# Altium schematic sheet Atrium_Power_Island.SchDoc
size 420 x 297 mm; Symbol: Drawing-Symbol_A3; @Project Name: Atrium; @Page Count: 1; @Update Date: 2026-11-08; @Create Date: 2026-11-08; @Schematic Name: Power_Schematic; @Page No: 1; @Page Name: P1; Company: EasyEDA.com; Version: V1.0; Page Size: A3; Device: Drawing-Symbol_A3; @Create Time: 01:36:29; @Update Time: 01:36:29; Border: 1; Width: 1655; Height: 1170; Region Start: 1; X Region Count: 6; Y Region Count: 4; Blade Width: 10; Title Block Position: 3; @Board Name: Power_Island
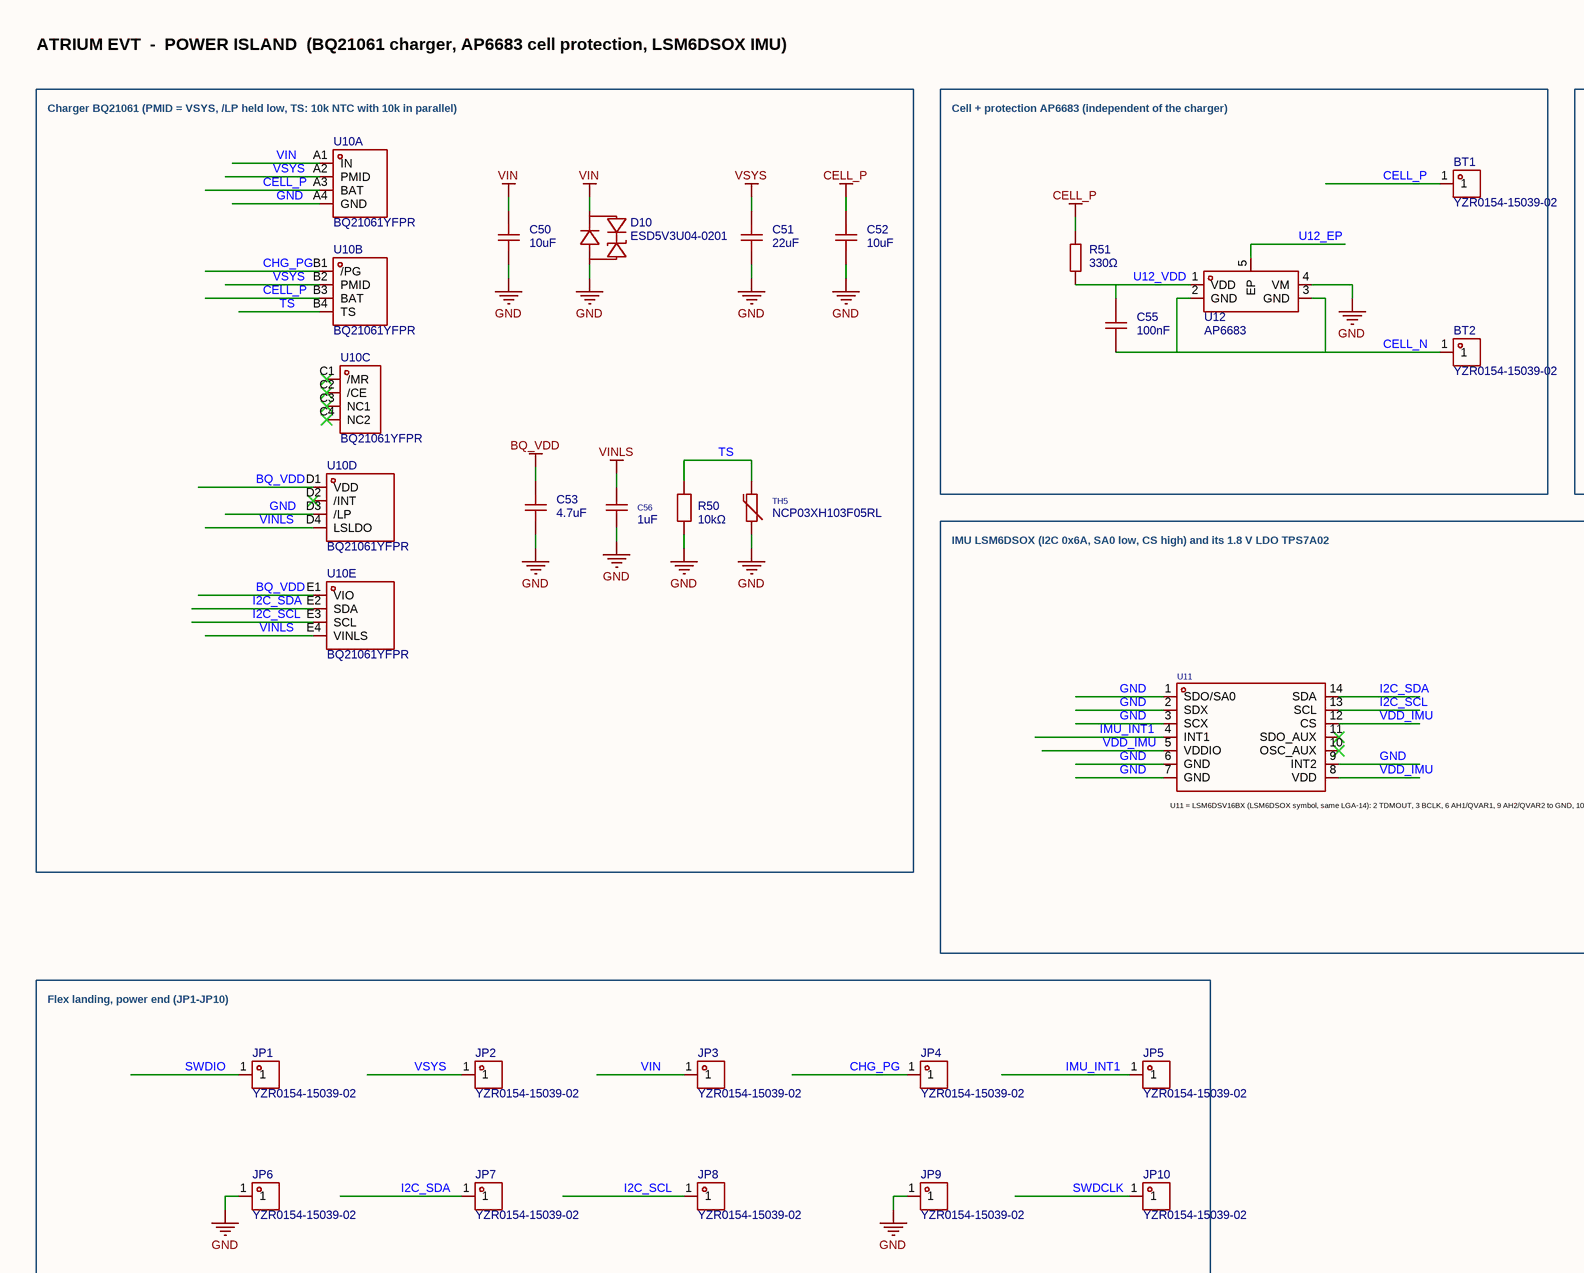
[diagram p0: Atrium_Power_Island.SchDoc, top left]
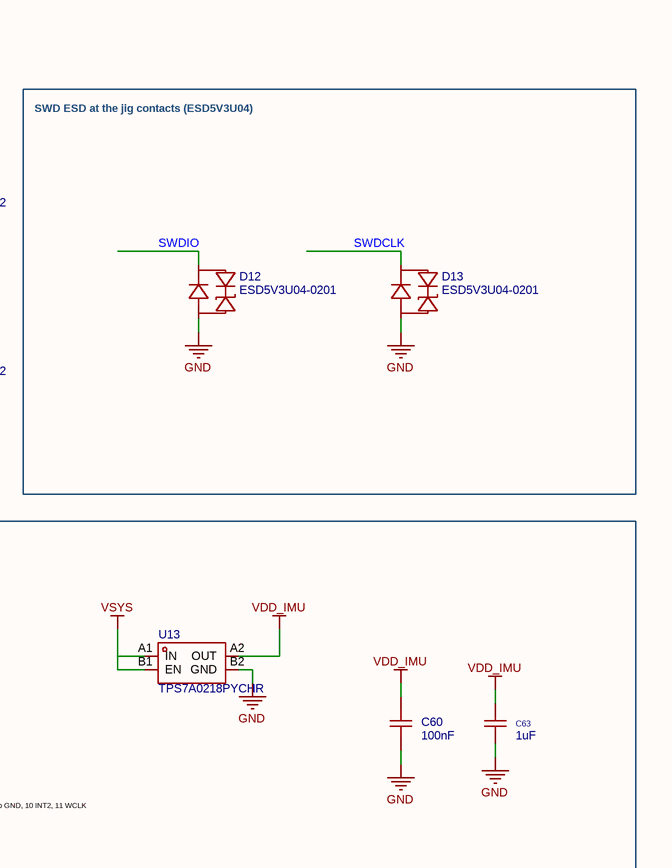
[diagram p1: Atrium_Power_Island.SchDoc, top right]
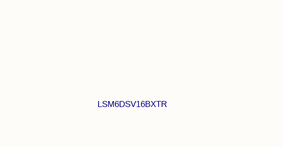
[diagram p2: Atrium_Power_Island.SchDoc, bottom left]

## Parts
BT1  YZR0154-15039-02  [TESTPOINT-SMD_BD1.5-H3.9]
BT2  YZR0154-15039-02  [TESTPOINT-SMD_BD1.5-H3.9]
C50  10uF  [C0402]
C51  22uF  [C0402]
C52  10uF  [C0402]
C53  4.7uF  [C0402]
C55  100nF  [C0201]
C56  1uF  [C0201]
C60  100nF  [C0201]
C63  1uF  [C0201]
D10  ESD5V3U04-0201  [X3-DFN0603-2_L0.6-W0.3-RD]
D12  ESD5V3U04-0201  [X3-DFN0603-2_L0.6-W0.3-RD]
D13  ESD5V3U04-0201  [X3-DFN0603-2_L0.6-W0.3-RD]
JP1  YZR0154-15039-02  [TESTPOINT-SMD_BD1.5-H3.9]
JP2  YZR0154-15039-02  [TESTPOINT-SMD_BD1.5-H3.9]
JP3  YZR0154-15039-02  [TESTPOINT-SMD_BD1.5-H3.9]
JP4  YZR0154-15039-02  [TESTPOINT-SMD_BD1.5-H3.9]
JP5  YZR0154-15039-02  [TESTPOINT-SMD_BD1.5-H3.9]
JP6  YZR0154-15039-02  [TESTPOINT-SMD_BD1.5-H3.9]
JP7  YZR0154-15039-02  [TESTPOINT-SMD_BD1.5-H3.9]
JP8  YZR0154-15039-02  [TESTPOINT-SMD_BD1.5-H3.9]
JP9  YZR0154-15039-02  [TESTPOINT-SMD_BD1.5-H3.9]
JP10  YZR0154-15039-02  [TESTPOINT-SMD_BD1.5-H3.9]
R50  10kΩ  [R0201]
R51  330Ω  [R0201]
TH5  NCP03XH103F05RL  [R0201]
U10  BQ21061YFPR  [DSBGA-20_L2.0-W1.6-R4-C5-P0.40-BL-1]  (parts A,B,C,D,E of 5)
U11  LSM6DSV16BXTR  [LGA-14L_L3.0-W2.5-P0.50-TL]
U12  AP6683  [DFN-4_L1.0-W1.0-P0.65-BL-EP]
U13  TPS7A0218PYCHR  [WLCSP-4_L0.6-W0.6-P0.35-R2-C2-TL]

## Blocks framed on the sheet
Cell + protection AP6683 (independent of the charger): BT1 BT2 C55 R51 U12
SWD ESD at the jig contacts (ESD5V3U04): D12 D13
Flex landing, power end (JP1-JP10): JP1-JP10

## Nets
BQ_VDD: C53.1 U10.D1(VDD) U10.E1(VIO)
CELL_P: BT1.1 C52.1 R51.1 U10.A3(BAT) U10.B3(BAT)
GND: C50.2 C51.2 C52.2 C53.2 C56.2 C60.2 C63.2 D10.2(A) D12.2(A) D13.2(A) JP6.1 JP9.1 R50.2 TH5.2 U10.A4(GND) U10.D3(/LP) U11.1(SDO/SA0) U11.2(SDX) U11.3(SCX) U11.6(GND) U11.7(GND) U11.9(INT2) U12.4(VM) U13.B2(GND)
VDD_IMU: C60.1 C63.1 U11.5(VDDIO) U11.8(VDD) U11.12(CS) U13.A2(OUT)
VIN: C50.1 D10.1(K) JP3.1 U10.A1(IN)
VINLS: C56.1 U10.D4(LSLDO) U10.E4(VINLS)
VSYS: C51.1 JP2.1 U10.A2(PMID) U10.B2(PMID) U13.A1(IN) U13.B1(EN)
CELL_N: BT2.1 C55.2 U12.2(GND) U12.3(GND)
CHG_PG: JP4.1 U10.B1(/PG)
I2C_SCL: JP8.1 U10.E3(SCL) U11.13(SCL)
I2C_SDA: JP7.1 U10.E2(SDA) U11.14(SDA)
IMU_INT1: JP5.1 U11.4(INT1)
SWDCLK: D13.1(K) JP10.1
SWDIO: D12.1(K) JP1.1
TS: R50.1 TH5.1 U10.B4(TS)
U12_EP: U12.5(EP)
U12_VDD: C55.1 R51.2 U12.1(VDD)

Not connected (* = marked no-connect by the designer): U10 C1(/MR)* C2(/CE)* C3(NC1)* C4(NC2)* D2(/INT)*; U11 10(OSC_AUX)* 11(SDO_AUX)*

## Notes on the sheet
- ATRIUM EVT  -  POWER ISLAND  (BQ21061 charger, AP6683 cell protection, LSM6DSOX IMU)
- (near U10) Charger BQ21061 (PMID = VSYS, /LP held low, TS: 10k NTC with 10k in parallel)
- IMU LSM6DSOX (I2C 0x6A, SA0 low, CS high) and its 1.8 V LDO TPS7A02
- (near U11) U11 = LSM6DSV16BX (LSM6DSOX symbol, same LGA-14): 2 TDMOUT, 3 BCLK, 6 AH1/QVAR1, 9 AH2/QVAR2 to GND, 10 INT2, 11 WCLK
- Create at
- 2026-11-08
- Schematic
- Board
- Power_Schematic
- Power_Island
- Update at
- Page
- P1
- Drawn
- Reviewed
- Atrium
- Version
- V1.0
- Size
- A3
- Page  1  Total  1
- EasyEDA.com

## Library data of the parts
BT1 BT2 JP1-JP10 = YZR0154-15039-02: Type:Pogo Pin Number of Pins:1P Overall Length/Height:3.9mm Operational Height:3.1mm Contact Resistance:50mΩ Elastic Life:10000 times Current Rating:1A Voltage Rating:12V Contact Material:Lead-Free Copper Contact Plating:Gold Operating Temperature:-20℃~+7; Manufacturer: Xinyangze(鑫扬泽); Add into BOM: no; Overall Length/Height: 3.9mm; Operational Height: 3.1mm; Contact Resistance: 50mΩ; Current Rating: 1A; Voltage Rating: 12V; Symbol: YZR0154-15039-02; Device: YZR0154-15039-02; Convert to PCB: no; LCSC Part Name: POGO PIN贴片型弹簧顶针; Supplier Part: C5157388; Manufacturer Part: YZR0154-15039-02; Supplier Footprint: -; JLCPCB Part Class: Extended Part; Datasheet: https://item.szlcsc.com/datasheet/YZR0154-15039-02/5795506.html; Supplier: LCSC; Type: Pogo Pin; Number of Pins: 1P; Elastic Life: 10000 times; Contact Material: Lead-Free Copper; Contact Plating: Gold; Operating Temperature: -20℃~+70℃; FootprintName: TESTPOINT-SMD_BD1.5-H3.9
C50 C52 = CL05A106MP5NUNC_C315248: Capacitance:10uF Tolerance:±20% Tolerance:±20% Voltage Rating:10V Temperature Coefficient:X5R; Manufacturer: SAMSUNG(三星); Add into BOM: yes; Tolerance: ±20%; Voltage Rating: 10V; Temperature Coefficient: X5R; ModelId: b7d13df3e9464d7a99d0651d1a5b4d570819f05c4eef4c71ace90d822a990e87; ModelName: C0402_L1.0-W0.5-H0.5; ModelTransform: 39.37,19.685,0,0,0,0,0,0,0; Symbol: CL05A106MP5NUNC_C315248; Device: CL05A106MP5NUNC_C315248; Convert to PCB: yes; Manufacturer Part: CL05A106MP5NUNC; Supplier: LCSC; Supplier Part: C315248; LCSC Part Name: 10uF ±20% 10V; Supplier Footprint: 0402; JLCPCB Part Class: Extended Part; Datasheet: https://item.szlcsc.com/datasheet/CL05A106MP5NUNC/297154.html; Value: 10uF; FootprintName: C0402
C51 = GRM155R60J226ME11D: Capacitance:22uF Tolerance:±20% Tolerance:±20% Voltage Rating:6.3V Temperature Coefficient:X5R; Manufacturer: muRata(村田); Add into BOM: yes; Tolerance: ±20%; Voltage Rating: 6.3V; Temperature Coefficient: X5R; ModelId: b7d13df3e9464d7a99d0651d1a5b4d570819f05c4eef4c71ace90d822a990e87; ModelName: C0402_L1.0-W0.5-H0.5; ModelTransform: 39.37,19.685,0,0,0,0,0,0,0; Symbol: GRM155R60J226ME11D; Device: GRM155R60J226ME11D; Convert to PCB: yes; Manufacturer Part: GRM155R60J226ME11D; Supplier: LCSC; Supplier Part: C415703; LCSC Part Name: 22uF ±20% 6.3V; Supplier Footprint: 0402; JLCPCB Part Class: Extended Part; Datasheet: https://item.szlcsc.com/datasheet/GRM155R60J226ME11D/408393.html; Value: 22uF; FootprintName: C0402
C53 = CL05A475MP5NRNC: Capacitance:4.7uF Tolerance:±20% Tolerance:±20% Voltage Rating:10V Temperature Coefficient:X5R; Manufacturer: SAMSUNG(三星); Add into BOM: yes; 3D Model: b7d13df3e9464d7a99d0651d1a5b4d570819f05c4eef4c71ace90d822a990e87; 3D Model Transform: 39.37,19.685,0,0,0,0,0,0,0; Tolerance: ±20%; Voltage Rating: 10V; Temperature Coefficient: X5R; ModelName: C0402_L1.0-W0.5-H0.5; Symbol: CL05A475MP5NRNC; Device: CL05A475MP5NRNC; Convert to PCB: yes; LCSC Part Name: 4.7uF ±20% 10V; Supplier Part: C23733; Manufacturer Part: CL05A475MP5NRNC; Supplier Footprint: 0402; JLCPCB Part Class: Basic Part; Datasheet: https://item.szlcsc.com/datasheet/CL05A475MP5NRNC/24469.html; Supplier: LCSC; Value: 4.7uF; FootprintName: C0402
C55 C60 = GRM033R60J104KE19D: Capacitance:100nF Tolerance:±10% Tolerance:±10% Voltage Rating:6.3V Temperature Coefficient:X5R; Manufacturer: muRata(村田); Add into BOM: yes; Tolerance: ±10%; Voltage Rating: 6.3V; Temperature Coefficient: X5R; ModelId: c3e75c3d90204c70b153866ab54c789f0819f05c4eef4c71ace90d822a990e87; ModelName: C0201_L0.6-W0.3-H0.3; ModelTransform: 23.622,11.811,0,0,0,0,0,0,0; Symbol: GRM033R60J104KE19D; Device: GRM033R60J104KE19D; Convert to PCB: yes; Manufacturer Part: GRM033R60J104KE19D; Supplier: LCSC; Supplier Part: C76928; LCSC Part Name: 100nF ±10% 6.3V; Supplier Footprint: 0201; JLCPCB Part Class: Extended Part; Datasheet: https://item.szlcsc.com/datasheet/GRM033R60J104KE19D/78055.html; Value: 100nF; FootprintName: C0201
C56 C63 = GRM033R60J105KEA2D: Capacitance:1uF Tolerance:±10% Tolerance:±10% Voltage Rating:6.3V Temperature Coefficient:X5R; Manufacturer: muRata(村田); Add into BOM: yes; Tolerance: ±10%; Voltage Rating: 6.3V; Temperature Coefficient: X5R; ModelId: c3e75c3d90204c70b153866ab54c789f0819f05c4eef4c71ace90d822a990e87; ModelName: C0201_L0.6-W0.3-H0.3; ModelTransform: 23.622,11.811,0,0,0,0,0,0,0; Symbol: GRM033R60J105KEA2D; Device: GRM033R60J105KEA2D; Convert to PCB: yes; Manufacturer Part: GRM033R60J105KEA2D; Supplier: LCSC; Supplier Part: C76929; Value: 1uF; JLCPCB Part Class: Extended Part; LCSC Part Name: 1uF ±10% 6.3V; Supplier Footprint: 0201; Datasheet: https://item.szlcsc.com/datasheet/GRM033R60J105KEA2D/78056.html; FootprintName: C0201
D10 D12 D13 = ESD5V3U04-0201: Polarity:Unidirectional Reverse Stand-Off Voltage (Vrwm):5.3V Clamping Voltage:15V Peak Pulse Current (Ipp):3A@8/20us Reverse Leakage Current (Ir):10nA level of protection:IEC 61000-4-4；IEC 61000-4-5；IEC 61000-4-2 Type:ESD Junction Capacitance:0.4pF; Manufacturer: TECH PUBLIC(台舟); Add into BOM: yes; 3D Model: 3709796f0342448b909f7538c3b856250819f05c4eef4c71ace90d822a990e87; 3D Model Transform: 26.18105,15.39367,0,0,0,0,0,0,0; Reverse Stand-Off Voltage (Vrwm): 5.3V; Clamping Voltage: 15V; Reverse Leakage Current (Ir): 10nA; Type: ESD; Junction Capacitance: 0.4pF; ModelName: X3-DFN0603-2_L0.6-W0.3-H0.3-RD; Symbol: ESD5V3U04-0201; Device: ESD5V3U04-0201; Convert to PCB: yes; LCSC Part Name: 单向 5.3V截止; Supplier Part: C521889; Manufacturer Part: ESD5V3U04-0201; Supplier Footprint: 0201; JLCPCB Part Class: Extended Part; Datasheet: https://item.szlcsc.com/datasheet/ESD5V3U04-0201/539383.html; Supplier: LCSC; Polarity: Unidirectional; Peak Pulse Current (Ipp): 3A@8/20us; level of protection: IEC 61000-4-4；IEC 61000-4-5；IEC 61000-4-2; FootprintName: X3-DFN0603-2_L0.6-W0.3-RD
R50 = 0201WMF1002TEE: Type:Thick Film Resistors Resistance:10kΩ Tolerance:±1% Tolerance:±1% Power(Watts): Overload Voltage (Max): Temperature Coefficient:±200ppm/℃ Temperature Coefficient:±200ppm/℃ Operating Temperature Range:-55℃~+155℃ Operating Temperature Range:-55℃~+155℃; Manufacturer: UNI-ROYAL(厚声); Add into BOM: yes; Tolerance: ±1%; ModelId: d3c6830bf3df48b598874c11a7d9c8170819f05c4eef4c71ace90d822a990e87; ModelName: R0201_L0.6-W0.3-H0.3; ModelTransform: 23.622,11.811,0,0,0,0,0,-0.0005,0; Symbol: 0201WMF1002TEE; Device: 0201WMF1002TEE; Convert to PCB: yes; Manufacturer Part: 0201WMF1002TEE; Supplier: LCSC; Supplier Part: C473048; LCSC Part Name: 10kΩ ±1% 50mW 厚膜电阻; Supplier Footprint: 0201; JLCPCB Part Class: Extended Part; Datasheet: https://atta.szlcsc.com/upload/public/pdf/source/20200306/C422600_1E6D84923E4A46A82E41ADD87F860B5C.pdf; Type: Thick Film Resistors; Value: 10kΩ; Temperature Coefficient: ±200ppm/℃; Operating Temperature Range: -55℃~+155℃; FootprintName: R0201
R51 = RC0201FR-07330RL: Type:Thick Film Resistor Resistance:330Ω Tolerance:±1% Tolerance:±1% Power(Watts):50mW Voltage-Supply(Max):25V Temperature Coefficient:±200ppm/℃ Temperature Coefficient:±200ppm/℃ Operating Temperature:-55℃~+125℃ Operating Temperature:-55℃~+125℃; Manufacturer: YAGEO(国巨); Add into BOM: yes; Tolerance: ±1%; Power(Watts): 50mW; Voltage-Supply(Max): 25V; ModelId: d3c6830bf3df48b598874c11a7d9c8170819f05c4eef4c71ace90d822a990e87; ModelName: R0201_L0.6-W0.3-H0.3; ModelTransform: 23.622,11.811,0,0,0,0,0,-0.0005,0; Symbol: RC0201FR-07330RL; Device: RC0201FR-07330RL; Convert to PCB: yes; Manufacturer Part: RC0201FR-07330RL; Supplier: LCSC; Supplier Part: C274872; LCSC Part Name: 厚膜电阻 330Ω ±1% 50mW; Supplier Footprint: 0201; JLCPCB Part Class: Extended Part; Datasheet: https://item.szlcsc.com/datasheet/RC0201FR-07330RL/263580.html; Type: Thick Film Resistor; Value: 330Ω; Temperature Coefficient: ±200ppm/℃; Operating Temperature: -55℃~+125℃; FootprintName: R0201
TH5 = NCP03XH103F05RL: Resistance @ 25℃:10kΩ B Constant (25℃/50℃):3380K Resistance Tolerance:±1% Resistance Tolerance:±1% B Constant (25℃/85℃):3434K B Constant (25℃/100℃):3455K Power(Watts):100mW B Constant Tolerance:±1% Operating Temperature:-40℃~+125℃ Operating Temperature:-4; Manufacturer: muRata(村田); Add into BOM: yes; 3D Model: d3c6830bf3df48b598874c11a7d9c8170819f05c4eef4c71ace90d822a990e87; 3D Model Transform: 23.622,11.811,0,0,0,0,0,-0.0005,0; Resistance @ 25℃: 10kΩ; B Constant (25℃/50℃): 3380K; Resistance Tolerance: ±1%; B Constant (25℃/85℃): 3434K; B Constant (25℃/100℃): 3455K; Power(Watts): 100mW; Dissipation Factor: 1mW/℃; Value: 10KΩ; ModelName: R0201_L0.6-W0.3-H0.3; Symbol: NCP03XH103F05RL; Device: NCP03XH103F05RL; Convert to PCB: yes; LCSC Part Name: 10kΩ 3380K 100mW; Supplier Footprint: 0201; Datasheet: https://item.szlcsc.com/datasheet/NCP03XH103F05RL/99307.html; B Constant Tolerance: ±1%; Operating Temperature: -40℃~+125℃; Manufacturer Part: NCP03XH103F05RL; Supplier: LCSC; Supplier Part: C98098; JLCPCB Part Class: Extended Part; FootprintName: R0201
U10 = BQ21061YFPR: The Chip Type:Charging IC Voltage - Supply:3.15V~5.25V Voltage - Supply:3.15V~5.25V Charge Current - Max:500mA Charging Saturation Voltage:4.6V End-Off Voltage:- Type of Battery:Lithium Battery Number of Cells:1 Number of Cells:1 Operating Temperature:-40; Manufacturer: TI(德州仪器); Add into BOM: yes; Relevance: []; Charge Current - Max: 500mA; Charging Saturation Voltage: 4.6V; Number of Cells: 1; Battery Temperature Detection: Support; Supply Current (Iq): 10nA; Interface: I2C; ModelId: 2dc4f48d91a74a9b84934211c4c2cffe0819f05c4eef4c71ace90d822a990e87; ModelTransform: 78.74,62.992,0,0,0,0,0,0,0; Symbol: BQ21061YFPR; Device: BQ21061YFPR; Convert to PCB: yes; Manufacturer Part: BQ21061YFPR; Supplier: LCSC; Supplier Part: C2869893; LCSC Part Name: 具有10nA运输模式、拥有稳定系统（PMID）电压的电源路径和LDO的I²C控制型单节电池线性电池充电器; Supplier Footprint: DSBGA-20; JLCPCB Part Class: Extended Part; Datasheet: https://www.ti.com/cn/lit/ds/symlink/bq21061.pdf; The Chip Type: Charging IC; Voltage - Supply: 3.15V~5.25V; End-Off Voltage: -; Type of Battery: Lithium Battery; Operating Temperature: -40℃~+85℃; 0V Battery Charge: -; Balance Current: -; FootprintName: DSBGA-20_L2.0-W1.6-R4-C5-P0.40-BL-1; ModelName: DSBGA-20_L2.0-W1.6-R4-C5-P0.40-BL-1
U11 = LSM6DSOXTR: Accelerometer Sensing Axis:X,Y,Z Acceleration Measurement Range (MAX):±16g Acceleration Measurement Range (MAX):±16g Gyroscope Sensing Axis:X,Y,Z Gyroscope Measurement Range (MAX):±2000dps Gyroscope Measurement Range (MAX):±2000dps Sensor Type:IMU (accele; Manufacturer: ST(意法半导体); Add into BOM: yes; 3D Model: ba71f3cdab504178a9a45bd067d2295b0819f05c4eef4c71ace90d822a990e87; 3D Model Transform: 118.11,98.425,0,0,0,0,0,0.0005,0; Accelerometer Sensing Axis: X,Y,Z; Acceleration Measurement Range (MAX): ±16g; Gyroscope Measurement Range (MAX): ±4000dps; Sensor Type: IMU (accelerometer + gyroscope); Interface: I2C；SPI; Voltage - Supply: 1.71V~3.6V; Cache Size: 9KB; Standby Current: 3uA; ModelName: LGA-14_L2.5-W3.0-H0.9-P0.50; Symbol: LSM6DSOXTR; Device: LSM6DSOXTR; Convert to PCB: yes; LCSC Part Name: iNEMO 6-axis IMU with bone-conduction audio channel and Qvar; Supplier Part: C5267394; Manufacturer Part: LSM6DSV16BXTR; Supplier Footprint: LGA-14(2.5x3); JLCPCB Part Class: Extended Part; Datasheet: https://www.st.com/resource/en/datasheet/lsm6dsv16bx.pdf; Supplier: LCSC; Gyroscope Sensing Axis: X,Y,Z; Output Bits: -; Operating Temperature: -40℃~+85℃; Features: Motion event detection；Synchronization and timestamp; FootprintName: LGA-14L_L3.0-W2.5-P0.50-TL
U12 = AP6683: The Chip Type:Protection IC Voltage - Supply:- Voltage - Supply:- Charge Current - Max:- Charging Saturation Voltage:- End-Off Voltage:2.8V Type of Battery:Lithium Battery Number of Cells:1 Number of Cells:1 Operating Temperature:-40℃~+85℃ Operating Tempe; Manufacturer: ALLPOWER(铨力); Add into BOM: yes; End-Off Voltage: 2.8V; Number of Cells: 1; Battery Temperature Detection: Not supported; 0V Battery Charge: Support; Supply Current (Iq): 100nA; ModelId: 24d5c39066eb4884abbd03a96c3031580819f05c4eef4c71ace90d822a990e87; ModelName: DFN-4_L1.0-W1.0-H0.5-P0.65-BL-EP; ModelTransform: 40.1574,40.1574,0,0,0,0,0.18,0.02,0; Symbol: AP6683; Device: AP6683; Convert to PCB: yes; Manufacturer Part: AP6683; Supplier: LCSC; Supplier Part: C2849565; LCSC Part Name: 单节锂离子和锂聚合物电池保护集成电路; Supplier Footprint: DFN-4-EP(1x1); JLCPCB Part Class: Extended Part; Datasheet: https://item.szlcsc.com/datasheet/AP6683/3049182.html; The Chip Type: Protection IC; Voltage - Supply: -; Charge Current - Max: -; Charging Saturation Voltage: -; Type of Battery: Lithium Battery; Operating Temperature: -40℃~+85℃; Balance Current: -; Interface: -; Features: Overcurrent Protection；Overcharge protection；Over-discharge protection；Short-Circuit  Protection; FootprintName: DFN-4_L1.0-W1.0-P0.65-BL-EP
U13 = TPS7A0218PYCHR: Output Configuration:Positive Voltage - Supply:6V Output Voltage:1.8V Output Voltage:1.8V Output Current:200mA Power Supply Rejection Ratio (PSRR):55dB@(1kHz) Voltage Dropout:490mV@(200mA) standby current:25nA Noise:130uVrms Features:Enable control；Output; Manufacturer: TI(德州仪器); Add into BOM: yes; Voltage - Supply: 6V; Output Voltage: 1.8V; standby current: 25nA; Output Type: Fixed; Number of Outputs: 1; ModelId: 45b24646604d4389881586579a55f4670819f05c4eef4c71ace90d822a990e87; ModelName: WLCSP-4_L0.6-W0.6-H0.4-P0.35-R2-C2-TL; ModelTransform: 25.78735,25.78735,0,0,0,0,0,0,0; Symbol: TPS7A0218PYCHR; Device: TPS7A0218PYCHR; Convert to PCB: yes; Manufacturer Part: TPS7A0218PYCHR; Supplier: LCSC; Supplier Part: C3752366; LCSC Part Name: 1.8V 200mA 6V; Supplier Footprint: DSBGA-4(0.7x1.4); JLCPCB Part Class: Extended Part; Datasheet: https://www.ti.com/cn/lit/ds/symlink/tps7a02.pdf; Output Configuration: Positive; Output Current: 200mA; Power Supply Rejection Ratio (PSRR): 55dB@(1kHz); Voltage Dropout: 490mV@(200mA); Noise: 130uVrms; Features: Enable control；Output discharge；Over Current Protection；Thermal shutdown；Input under-voltage protection; Operating Temperature: -40℃~+125℃@(Tj); FootprintName: WLCSP-4_L0.6-W0.6-P0.35-R2-C2-TL